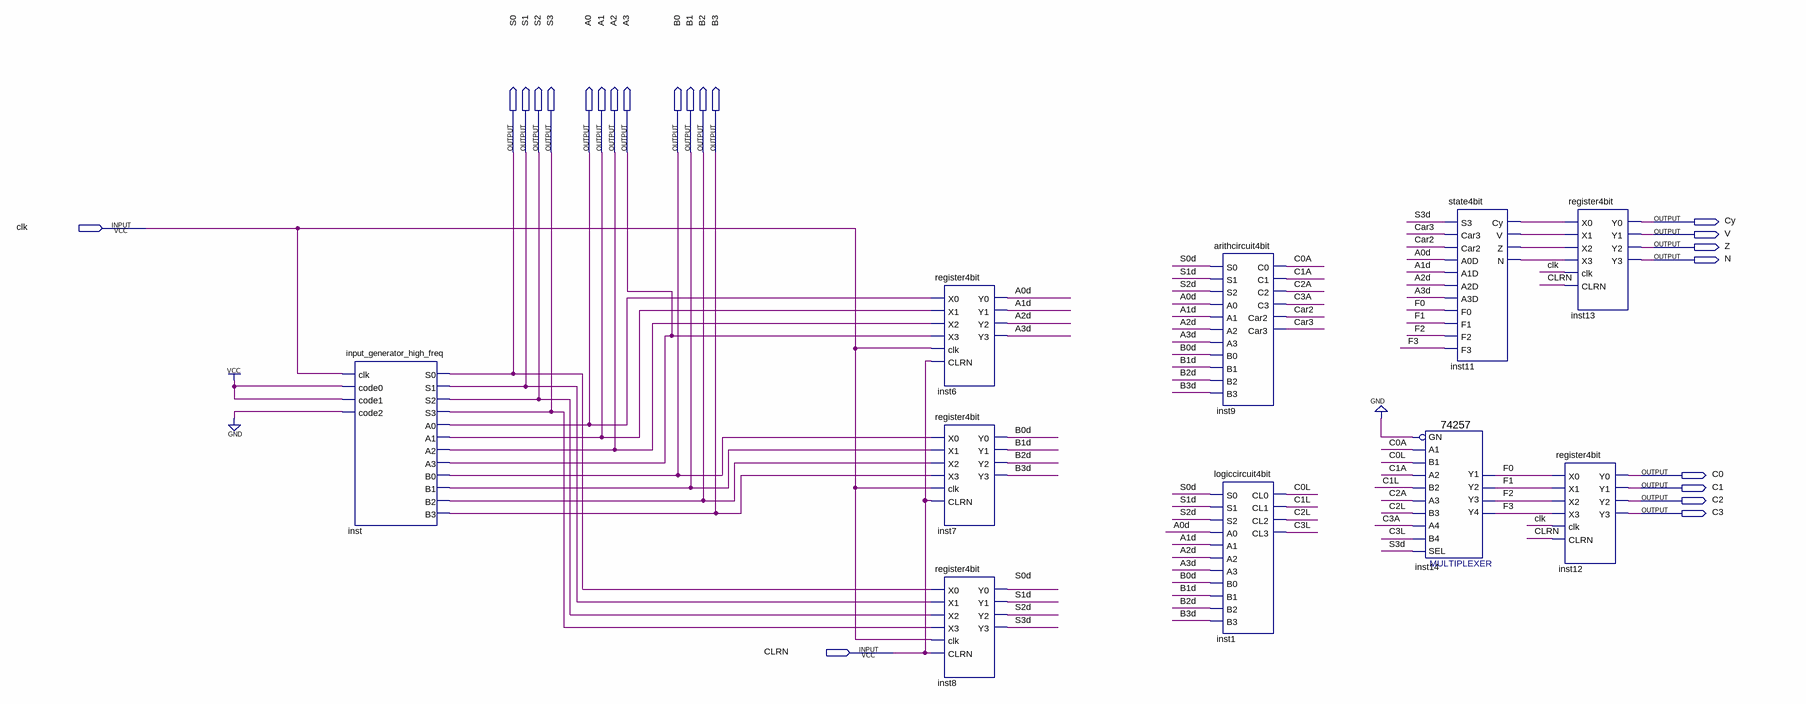
[diagram p0: schematic sheet]
// Quartus schematic Lab3_top.bdf as structural Verilog: 10 symbols, 22 pins
module Lab3_top (
  input  clk,
  input  CLRN,
  output S0,
  output S1,
  output S2,
  output S3,
  output A0,
  output A1,
  output A2,
  output A3,
  output B0,
  output B1,
  output B2,
  output B3,
  output Cy,
  output V,
  output Z,
  output N,
  output C0,
  output C1,
  output C2,
  output C3
);

  wire A0d, A1d, A2d, A3d, B0d, B1d, B2d, B3d, C0A, C0L, C1A, C1L, C2A, C2L, C3A, C3L, Car2, Car3, F0, F1,
       F2, F3, inst11_cy, inst11_n, inst11_v, inst11_z, S0d, S1d, S2d, S3d;

  input_generator_high_freq inst (
    .clk(clk), .code0(1'b1), .code1(1'b1), .code2(1'b0), .S0(S0), .S1(S1), .S2(S2), .S3(S3), .A0(A0),
    .A1(A1), .A2(A2), .A3(A3), .B0(B0), .B1(B1), .B2(B2), .B3(B3));
  register4bit inst6 (
    .X0(A0), .X1(A1), .X2(A2), .X3(A3), .clk(clk), .CLRN(CLRN), .Y0(A0d), .Y1(A1d), .Y2(A2d), .Y3(A3d));
  register4bit inst7 (
    .X0(B0), .X1(B1), .X2(B2), .X3(B3), .clk(clk), .CLRN(CLRN), .Y0(B0d), .Y1(B1d), .Y2(B2d), .Y3(B3d));
  register4bit inst8 (
    .X0(S0), .X1(S1), .X2(S2), .X3(S3), .clk(clk), .CLRN(CLRN), .Y0(S0d), .Y1(S1d), .Y2(S2d), .Y3(S3d));
  arithcircuit4bit inst9 (
    .S0(S0d), .S1(S1d), .S2(S2d), .A0(A0d), .A1(A1d), .A2(A2d), .A3(A3d), .B0(B0d), .B1(B1d), .B2(B2d),
    .B3(B3d), .C0(C0A), .C1(C1A), .C2(C2A), .C3(C3A), .Car2(Car2), .Car3(Car3));
  logiccircuit4bit inst1 (
    .S0(S0d), .S1(S1d), .S2(S2d), .A0(A0d), .A1(A1d), .A2(A2d), .A3(A3d), .B0(B0d), .B1(B1d), .B2(B2d),
    .B3(B3d), .CL0(C0L), .CL1(C1L), .CL2(C2L), .CL3(C3L));
  \74257  inst14 (
    .B1(C0L), .A1(C0A), .B3(C2L), .A2(C1A), .B2(C1L), .A3(C2A), .A4(C3A), .B4(C3L), .SEL(S3d), .GN(1'b0),
    .Y2(F1), .Y3(F2), .Y4(F3), .Y1(F0));
  state4bit inst11 (
    .S3(S3d), .Car3(Car3), .Car2(Car2), .A0D(A0d), .A1D(A1d), .A2D(A2d), .A3D(A3d), .F0(F0), .F1(F1),
    .F2(F2), .F3(F3), .Cy(inst11_cy), .V(inst11_v), .Z(inst11_z), .N(inst11_n));
  register4bit inst13 (
    .X0(inst11_cy), .X1(inst11_v), .X2(inst11_z), .X3(inst11_n), .clk(clk), .CLRN(CLRN), .Y0(Cy), .Y1(V),
    .Y2(Z), .Y3(N));
  register4bit inst12 (.X0(F0), .X1(F1), .X2(F2), .X3(F3), .clk(clk), .CLRN(CLRN), .Y0(C0), .Y1(C1), .Y2(C2), .Y3(C3));
endmodule
